# Altium project DemoProject.PrjPcb
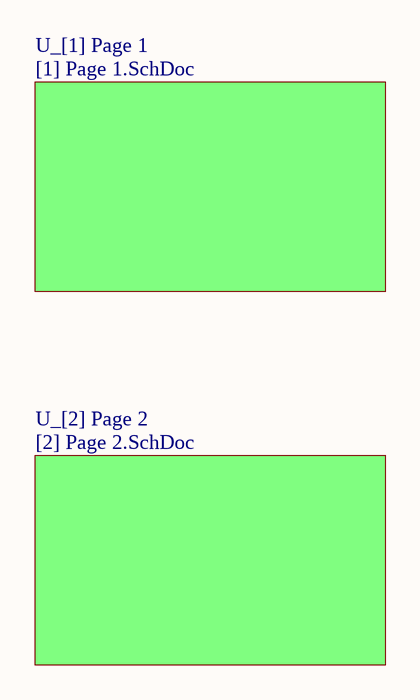
[diagram p0: EntranceSheet.SchDoc]
3 sheets, 13 parts. Net scope: flat (ports and power ports of the same name join across sheets).
Board file: DemoProject_PCB.PcbDoc
Sheets:
  EntranceSheet.SchDoc
    U_[1] Page 1 = [1] Page 1.SchDoc
    U_[2] Page 2 = [2] Page 2.SchDoc

## Sheet EntranceSheet.SchDoc
size Letter; DocumentNumber: 0; SheetNumber: 0

### Sub-sheets
U_[1] Page 1 = [1] Page 1.SchDoc: no entries
U_[2] Page 2 = [2] Page 2.SchDoc: no entries

## Sheet [1] Page 1.SchDoc
size Letter; DocumentNumber: 1; SheetNumber: 1
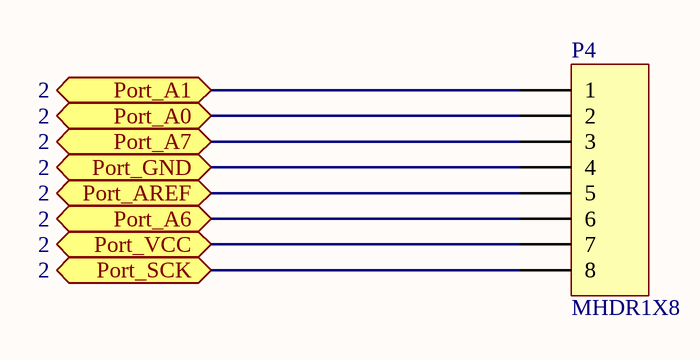
[diagram p1: [1] Page 1.SchDoc]

### Parts
P4  MHDR1X8  [MHDR1X8]

### Ports
Port_A0 (bidir, see 2), Port_A1 (bidir, see 2), Port_A6 (bidir, see 2), Port_A7 (bidir, see 2), Port_AREF (bidir, see 2), Port_GND (bidir, see 2), Port_SCK (bidir, see 2), Port_VCC (bidir, see 2)

### Nets
NetP4_1: P4.1 ; port Port_A1
NetP4_2: P4.2 ; port Port_A0
NetP4_3: P4.3 ; port Port_A7
NetP4_4: P4.4 ; port Port_GND
NetP4_5: P4.5 ; port Port_AREF
NetP4_6: P4.6 ; port Port_A6
NetP4_7: P4.7 ; port Port_VCC
NetP4_8: P4.8 ; port Port_SCK

### Library data of the parts
P4 = MHDR1X8: Header, 8-Pin; LatestRevisionDate: 17-Jul-2002; LatestRevisionNote: Re-released for DXP Platform.; Publisher: Altium Limited

## Sheet [2] Page 2.SchDoc
size Letter; DocumentNumber: 2; SheetNumber: 2
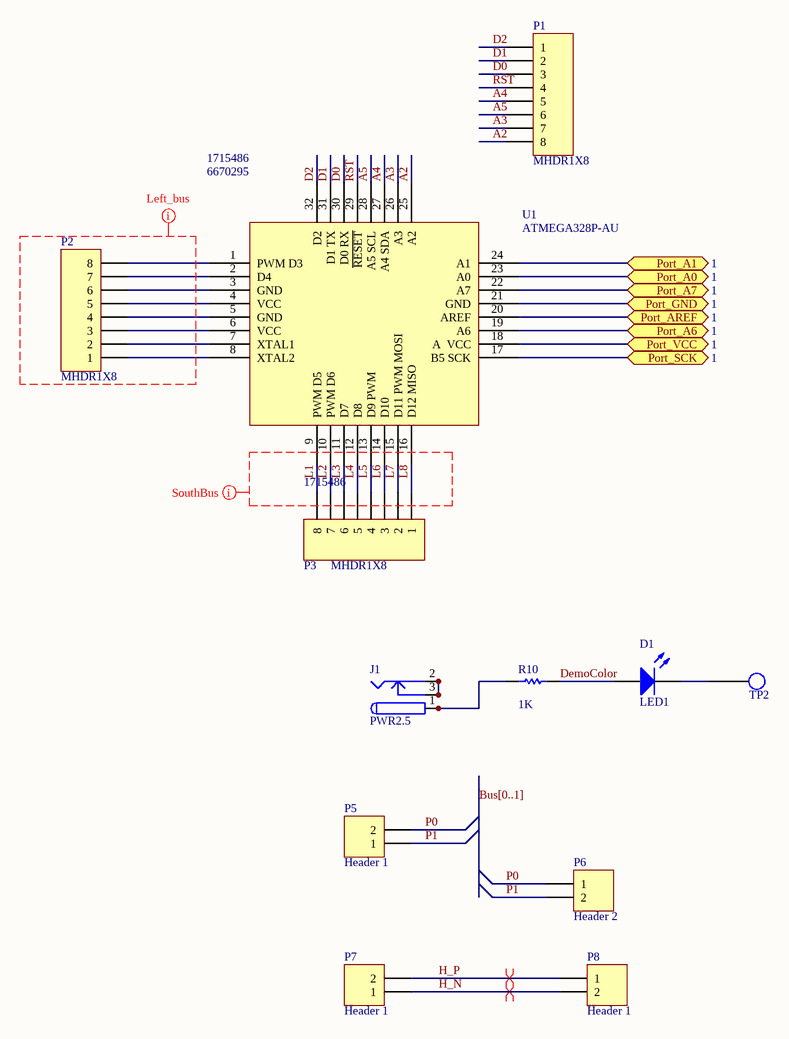
[diagram p2: [2] Page 2.SchDoc]

### Parts
D1  LED1  [LED-1]
J1  PWR2.5  [KLD-0202]
P1  MHDR1X8  [MHDR1X8]
P2  MHDR1X8  [MHDR1X8]
P3  MHDR1X8  Supplier Part Number 1: 1715486  [MHDR1X8]
P5  Header 1  [HDR1X2]
P6  Header 2  [HDR1X2]
P7  Header 1  [HDR1X2]
P8  Header 1  [HDR1X2]
R10  value 1K  [AXIAL-0.3]  (hidden comment: Res1)
TP2  Test Point  [PCBComponent_1]  (value not drawn)  (no BOM)
U1  ATMEGA328P-AU  Supplier Part Number 1: 6670295  Supplier Part Number 2: 1715486  [TQFP80P900X900X120-32N]

### Ports
Port_A0 (bidir, see 1), Port_A1 (bidir, see 1), Port_A6 (bidir, see 1), Port_A7 (bidir, see 1), Port_AREF (bidir, see 1), Port_GND (bidir, see 1), Port_SCK (bidir, see 1), Port_VCC (bidir, see 1)

### Nets
A2: P1.8 U1.25(A2)
A3: P1.7 U1.26(A3)
A4: P1.5 U1.27(A4_SDA)
A5: P1.6 U1.28(A5_SCL)
D0: P1.3 U1.30(D0_RX)
D1: P1.2 U1.31(D1_TX)
D2: P1.1 U1.32(D2)
DemoColor: D1.1(A) R10.2
H_N: P7.1 P8.2
H_P: P7.2 P8.1
L1: P3.8 U1.9(PWM_D5)
L2: P3.7 U1.10(PWM_D6)
L3: P3.6 U1.11(D7)
L4: P3.5 U1.12(D8)
L5: P3.4 U1.13(D9_PWM)
L6: P3.3 U1.14(D10)
L7: P3.2 U1.15(D11_PWM_MOSI)
L8: P3.1 U1.16(D12_MISO)
P0: P5.2 P6.1
P1: P5.1 P6.2
RST: P1.4 U1.29(~{RESET})
NetD1_2: D1.2(K) TP2.TP
NetJ1_1: J1.1 J1.1A J1.1B R10.1
NetJ1_2: J1.2 J1.2A J1.2B J1.3 J1.3A J1.3B
NetP2_1: P2.1 U1.8(XTAL2)
NetP2_2: P2.2 U1.7(XTAL1)
NetP2_3: P2.3 U1.6(VCC)
NetP2_4: P2.4 U1.5(GND)
NetP2_5: P2.5 U1.4(VCC)
NetP2_6: P2.6 U1.3(GND)
NetP2_7: P2.7 U1.2(D4)
NetP2_8: P2.8 U1.1(PWM_D3)
NetP4_1: U1.24(A1) ; port Port_A1
NetP4_2: U1.23(A0) ; port Port_A0
NetP4_3: U1.22(A7) ; port Port_A7
NetP4_4: U1.21(GND) ; port Port_GND
NetP4_5: U1.20(AREF) ; port Port_AREF
NetP4_6: U1.19(A6) ; port Port_A6
NetP4_7: U1.18(A__VCC) ; port Port_VCC
NetP4_8: U1.17(B5_SCK) ; port Port_SCK

### Buses and harness runs
bus Bus[0..1]

### Layout directives
net class Left_bus: (no net found under the mark)
net class SouthBus: L1, L2, L3, L4, L5, L6, L7, L8
differential pair; net class Jum2Jump: H_N, H_P

### Library data of the parts
D1 = LED1: Typical RED GaAs LED; Published: 8-Jun-2000; LatestRevisionDate: 08-Jul-2005; LatestRevisionNote: Mech Layer 1 removed.; PackageReference: LED-1; Publisher: Altium Limited; PackageDescription: LED; 2 Leads
J1 = PWR2.5: Low Voltage Power Supply Connector; Published: 17-Dec-2003; DatasheetDocument: 09-May-2002; Publisher: Altium Limited; ComponentLink1Description: Manufacturer Link; ComponentLink1URL: http://domino.kycon.com/internet/Products.html
P1-P3 = MHDR1X8: Header, 8-Pin; LatestRevisionDate: 17-Jul-2002; LatestRevisionNote: Re-released for DXP Platform.; Publisher: Altium Limited
  P3: Supplier 1: Farnell
P5-P8 = Header 2: Header, 2-Pin; LatestRevisionDate: 17-Jul-2002; LatestRevisionNote: Re-released for DXP Platform.; Publisher: Altium Limited
R10 = Res1: Resistor; Published: 8-Jun-2000; LatestRevisionDate: 17-Jul-2002; LatestRevisionNote: Re-released for DXP Platform.; PackageReference: AXIAL-0.3; Publisher: Altium Limited; PackageDescription: Axial Device, Thru-Hole; 2 Leads; 0.3 in Pin Spacing
TP2 = TP
U1 = ATMEGA328P-AU: Microchip Technology ATMEGA328P-AU, 8bit AVR Microcontroller, 20MHz, 32 kB Flash, 32-Pin TQFP; Manufacturer Part Number: PIC24HJ256GP206A-I/PT; Family Name: PIC24HJ; Device Core: PIC; Data Bus Width: 16bit; Program Memory Size: 256 kB; Maximum Frequency: 40MIPS; RAM Size: 16 kB; Number of PWM Units: 1; ADC Channels: 18; Number of SPI Channels: 2; Typical Operating Supply Voltage: 3 → 3.6 V; Timers: 9 x 16 bit; ADCs: 18 x 10/12 bit; Pulse Width Modulation: 8 x16 bit; ADC Resolution: 10 bit, 12 bit; Number of Timers: 9; PWM Channels: 8; Instruction Set Architecture: RISC; Controller Family/Series: ATmega; CPU Speed: 20; No. of Pins: 32; No. of I/O's: 23; Embedded Interface Type: I2; Supply Voltage Min: 1.8; Supply Voltage Max: 5.5; Product Range: AVR Family ATmega328 Series Microcontrollers; SVHC: No SVHC (17-Dec-2015); Base Number: megaAVR; No. of PWM Channels: 6; No. of Timers: 3; Oscillator Type: External, Internal; Peripherals: ADC, Comparator, RTC; Supply Voltage Range: 1.8V to 5.5V<!--FANDB--><div class="features-and-benefits-container"><div class="features-and-benefits-description"><span class="features-benefits-value">The high-performance Atmel picoPower 8-bit AVR RISC-based microcontroller combines 32KB ISP flash memory with read-while-write capabilities, 1024B EEPROM, 2KB SRAM, 23 general purpose I/O lines, 32 general purpose working registers, three flexible timer/counters with compare modes, internal and external interrupts, serial programmable USART, a byte-oriented 2-wire serial interface, SPI serial port, a 6-channel 10-bit A/D converter (8-channels in TQFP and QFN/MLF packages), programmable watchdog timer with internal oscillator, and five software selectable power saving modes. The device operates between 1.8-5.5 volts.</span></div><div class="features-and-benefits-list"><ul class="features-and-benefits-list-list"><li class="features-and-benefits-list-item">High Performance, Low Power Atmel&reg; Created by: altay brusan; Create Date: 2018; RS stock no.: 131-0271; Datasheet URL: https://docs-emea.rs-online.com/webdocs/15b8/0900766b815b8e7b.pdf; Supplier 1: RSComponents; Manufacturer: Microchip; Stock 1: 5; Pricing 1: 1=5.58, 10=4.64, 25=4.25, 100=3.98 (EUR); Package Type: TQFP; Mounting Type: Surface Mount; Pin Count: 64; Maximum Operating Temperature: +85 °C; PWM Resolution: 16bit; Program Memory Type: Flash; Width: 10mm; Number of UART Channels: 2; Number of ADC Units: 1; Length: 10mm; Timer Resolution: 16bit; Minimum Operating Temperature: -40 °C; Dimensions: 10 x 10 x 1.05mm; Height: 1.05mm; Number of I2C Channels: 2; ComponentLink1URL: https://datasheet.ciiva.com/7665/70592b-7665720.pdf; ComponentLink1Description: https://datasheet.ciiva.com/7665/70592b-7665720.pdf; ComponentLink2URL: https://datasheet.ciiva.com/41454/001084738-da-01-en-ic-mcu-pic24hj256gp206a-i-pt-tqfp-64-mcp-41454056.pdf; ComponentLink2Description: https://datasheet.ciiva.com/41454/001084738-da-01-en-ic-mcu-pic24hj256gp206a-i-pt-tqfp-64-mcp-41454056.pdf; ComponentLink3URL: https://datasheet.ciiva.com/6656/70592d-6656821.pdf; ComponentLink3Description: https://datasheet.ciiva.com/6656/70592d-6656821.pdf; ComponentLink4URL: https://datasheet.ciiva.com/16289/70592d-16289717.pdf; ComponentLink4Description: https://datasheet.ciiva.com/16289/70592d-16289717.pdf; ComponentLink5URL: https://datasheet.ciiva.com/14131/pic24hjxxxgpx06a-x08a-x10a-eng-datasheet-14131719.pdf; ComponentLink5Description: https://datasheet.ciiva.com/14131/pic24hjxxxgpx06a-x08a-x10a-eng-datasheet-14131719.pdf; ComponentLink6URL: https://datasheet.ciiva.com/16877/70047449-16877383.pdf; ComponentLink6Description: https://datasheet.ciiva.com/16877/70047449-16877383.pdf; ComponentLink7URL: https://datasheet.ciiva.com/6128/1669484-6128859.pdf; ComponentLink7Description: https://datasheet.ciiva.com/6128/1669484-6128859.pdf; RoHS: YES; RAM Memory Size: 2; MCU Case Style: TQFP; Packaging: Each; Automotive Qualification Standard: -; RoHS Phthalates Compliant: Yes; MSL: MSL 3 - 168 hours; EEPROM Memory Size: 1; MCU Family: megaAVR; MCU Series: ATmega328; MPU Core Size: 8; No. of ADC Inputs: 8; Operating Temperature Max: 85; Operating Temperature Min: -40; Operating Temperature Range: -40°C to +85; ComponentLink8URL: http://bcove.me/gu8hm7kh; ComponentLink8Description: http://bcove.me/gu8hm7kh; ComponentLink9URL: http://www.farnell.com/datasheets/2295887.pdf; ComponentLink9Description: http://www.farnell.com/datasheets/2295887.pdf; ComponentLink10URL: http://www.farnell.com/cad/1774115.zip; ComponentLink10Description: http://www.farnell.com/cad/1774115.zip; ComponentLink11URL: http://www.farnell.com/datasheets/2156759.pdf; ComponentLink11Description: http://www.farnell.com/datasheets/2156759.pdf; Supplier 2: Farnell; Stock 2: 3290; Pricing 2: 1=1.58, 25=1.45, 100=1.31, 1000=1.28 (GBP)

## Nets that join several sheets
NetP4_1: [1] Page 1 (P4.1), [2] Page 2 (U1.24)
NetP4_2: [1] Page 1 (P4.2), [2] Page 2 (U1.23)
NetP4_3: [1] Page 1 (P4.3), [2] Page 2 (U1.22)
NetP4_4: [1] Page 1 (P4.4), [2] Page 2 (U1.21)
NetP4_5: [1] Page 1 (P4.5), [2] Page 2 (U1.20)
NetP4_6: [1] Page 1 (P4.6), [2] Page 2 (U1.19)
NetP4_7: [1] Page 1 (P4.7), [2] Page 2 (U1.18)
NetP4_8: [1] Page 1 (P4.8), [2] Page 2 (U1.17)